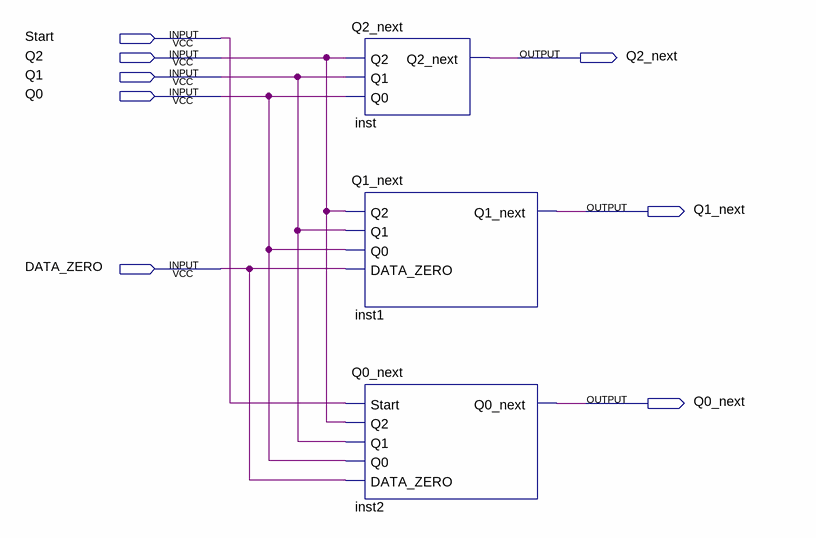
[diagram p0: schematic sheet]
// Quartus schematic next_state.bdf as structural Verilog: 3 symbols, 8 pins
module next_state (
  input  Start,
  input  Q2,
  input  Q1,
  input  Q0,
  input  DATA_ZERO,
  output Q2_next,
  output Q1_next,
  output Q0_next
);

  Q2_next inst (.Q2(Q2), .Q1(Q1), .Q0(Q0), .Q2_next(Q2_next));
  Q1_next inst1 (.Q2(Q2), .Q1(Q1), .Q0(Q0), .DATA_ZERO(DATA_ZERO), .Q1_next(Q1_next));
  Q0_next inst2 (.Start(Start), .Q2(Q2), .Q1(Q1), .Q0(Q0), .DATA_ZERO(DATA_ZERO), .Q0_next(Q0_next));
endmodule
